# Altium schematic sheet 1.power.SchDoc
size A4; Organization: ORGANIZATION; Address1: ADDRESS 1; Address2: ADDRESS 2; Address3: ADDRESS 3; Address4: ADDRESS 4; DocumentNumber: 2; SheetNumber: 2; SheetTotal: 8; ENG_APP_DATE: --/--/--; DSN_APP_DATE: --/--/--; CHK_APP_DATE: --/--/--; Page: Power; SPICEModelCacheBQMAEVYU: <root> / <DocumentId>BQMAEVYU</DocumentId> / <CacheFrame Number="0"> / <Model Name="irf9510" Kind="CKT"> / <Text>*IRF9510  MCE  4-2-96 / *100V  4A  1.2 ohms HEXFET pkg:TO-220 2,1,3 / .SUBCKT IRF9510  10 20 40 40 / M1   1  2  3  3  DMOS L=1U W=1U / RD  10  1  .569 / RS  30  3  31M / RG  20  2  37.5 / CGS  2  3  182P / EGD 12  0  1  2  1 / VFB 14  0  0 / FFB  1  2  VFB  1 / CGD 13 14  231P / R1  13  0  1 / D1  12 13  DLIM / DDG 15 14  DCGD / R2  12 15  1 / D2  15  0  DLIM / DSD 10  3  DSUB / LS  30 40  7.5N / .MODEL DMOS PMOS (LEVEL=3 THETA=60M VMAX=208K ETA=2M VTO=-3 KP=.471) / .MODEL DCGD D (CJO=231P VJ=.6 M=.68) / .MODEL DSUB D (IS=16.6N N=1.5 RS=1.18 BV=100 CJO=327P VJ=.8 M=.42 TT=82N) / .MODEL DLIM D (IS=100U) / .ENDS IRF9510</Text> / </Model> / </CacheFrame> / </root>
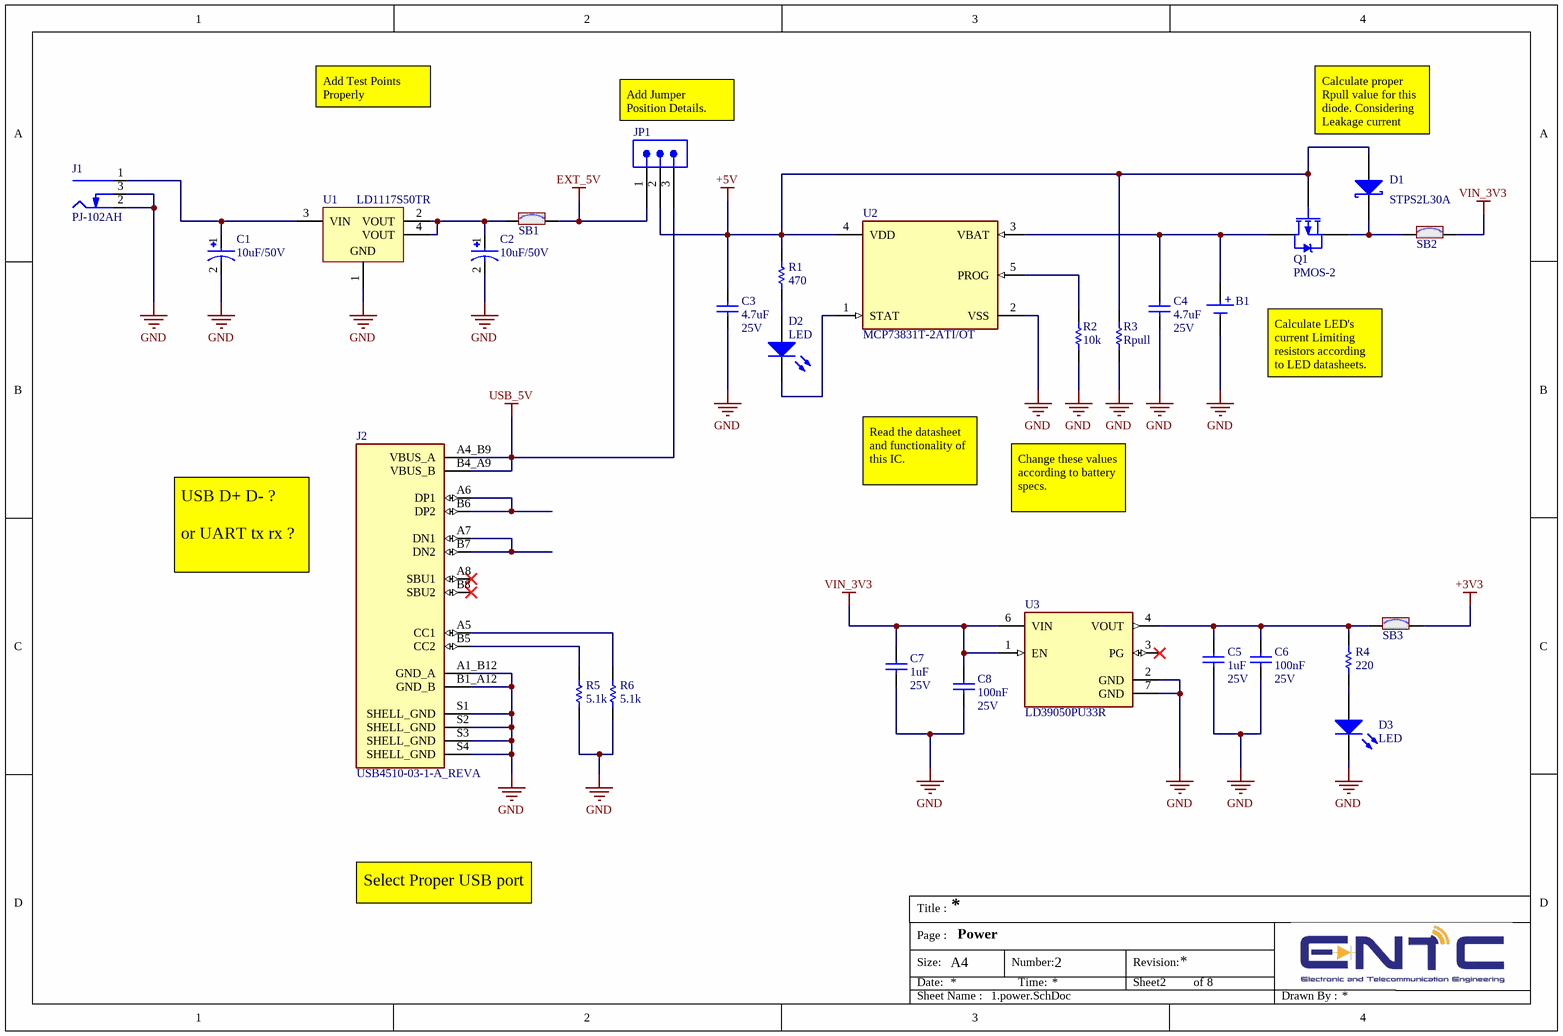
[diagram p0: 1.power.SchDoc]

## Parts
B1  (no value)  [18650_BATTERY_HOLDER]
C1  10uF/50V  [CAP1411]
C2  10uF/50V  [CAP1411]
C3  4.7uF  Voltage Rating: 25V  [cap0603]
C4  4.7uF  Voltage Rating: 25V  [cap0603]
C5  1uF  Voltage Rating: 25V  [cap0603]
C6  100nF  Voltage Rating: 25V  [cap0603]
C7  1uF  Voltage Rating: 25V  [cap0603]
C8  100nF  Voltage Rating: 25V  [cap0603]
D1  STPS2L30A
D2  LED  [LED0603]
D3  LED  [LED0603]
J1  PJ-102AH  [PJ-102AH]
J2  USB4510-03-1-A_REVA  [GCT_USB4510-03-1-A_REVA]
JP1  (no value)  [HEADER_FEMALE_3POS_P2.54MM]
Q1  PMOS-2  [TO-220AB]
R1  470  [RES0402]
R2  10k  [RES0402]
R3  Rpull  [RES0402]
R4  220  [RES0402]
R5  5.1k  [RES0402]
R6  5.1k  [RES0402]
SB1  SB_ON  [SOLDER-BRIDGE_R0603-0R]  (value not drawn)
SB2  SB_ON  [SOLDER-BRIDGE_R0603-0R]  (value not drawn)
SB3  SB_ON  [SOLDER-BRIDGE_R0603-0R]  (value not drawn)
U1  LD1117S50TR  [SOT-223_M]
U2  MCP73831T-2ATI/OT  [SOT95P280X145-5N]
U3  LD39050PU33R  [SON95P300X300X100-7N]

## Nets
+3V3: SB3.2
+5V: C3.2 D1.1(A) JP1.2 Q1.1(G) R1.2 R3.2 U2.4(VDD)
EXT_5V: JP1.1 SB1.2
GND: B1.2(-) C1.2 C2.2 C3.1 C4.1 C5.1 C6.1 C7.1 C8.1 D3.2(K) J1.2(Outer) J1.3(SW) J2.A1_B12(GND_A) J2.B1_A12(GND_B) J2.S1(SHELL_GND) J2.S2(SHELL_GND) J2.S3(SHELL_GND) J2.S4(SHELL_GND) R2.1 R3.1 R5.1 R6.1 U1.1(GND) U2.2(VSS) U3.2(GND) U3.7(GND)
USB_5V: J2.A4_B9(VBUS_A) J2.B4_A9(VBUS_B) JP1.3
VIN_3V3: C7.2 C8.2 SB2.2 U3.1(EN) U3.6(VIN)
NetB1_1: B1.1(+) C4.2 Q1.2(D) U2.3(VBAT)
NetC1_1: C1.1 J1.1(Centre) U1.3(VIN)
NetC2_1: C2.1 SB1.1 U1.2(VOUT) U1.4(VOUT)
NetC5_2: C5.2 C6.2 R4.2 SB3.1 U3.4(VOUT)
NetD1_2: D1.2(K) Q1.3(S) SB2.1
NetD2_1: D2.1(A) R1.1
NetD2_2: D2.2(K) U2.1(STAT)
NetD3_1: D3.1(A) R4.1
NetJ2_A5: J2.A5(CC1) R6.2
NetJ2_A6: J2.A6(DP1) J2.B6(DP2)
NetJ2_A7: J2.A7(DN1) J2.B7(DN2)
NetJ2_B5: J2.B5(CC2) R5.2
NetR2_2: R2.2 U2.5(PROG)

Not connected (* = marked no-connect by the designer): J2 A8(SBU1)* B8(SBU2)*; U3 3(PG)*

## Notes on the sheet
- Add Test Points Properly
- (near JP1) Add Jumper Position Details.
- Calculate proper Rpull value for this diode. Considering Leakage current
- Calculate LED's current Limiting resistors according to LED datasheets.
- Read the datasheet and functionality of this IC.
- Change these values according to battery specs.
- USB D+ D- ?
  or UART tx rx ?
- Select Proper USB port
- Title :
- Size:
- Date:
- Page :
- A4
- Number:
- Time:
- Revision:
- Sheet
- of
- Sheet Name :
- Drawn By :

## Library data of the parts
B1 = Battery_2: BATTERY HOLDER 18650 PC PIN; Part Number: 1043; Manufacturer: Keystone Electronics; Battery Cell Size: 18650; Battery Type, Function: Cylindrical, Holder; Number of Cells: 1; Style: Holder (Open); ComponentLink1Description: Datasheet; ComponentLink1URL: http://keyelco.com/userAssets/file/M65p27.pdf; ComponentLink2Description: DigiKey Link; ComponentLink2URL: http://digikey.com/product-detail/en/keystone-electronics/1043/36-1043-ND/2745669; Height Above Board: 0.585" (14.86mm); LastUpdated: 2/2/2020 9:19:56 AM; Lifecycle Status: Active; Minimum Order: 1; Mounting Type: PCB, Through Hole; Operating Temperature: -50°C ~ 145°C; Packaging: Unknown; PartId: 2; Part Status: Active; Price: 2.58; Series: -; Supplier 1: DigiKey; Supplier Part Number 1: 36-1043-ND; Termination Style: PC Pin
C1 C2 = Cap Pol: Polarized capacitor; Manufacturer: *; Manufacturer part number: *; JLCPCB part number: *
C3-C8 = Cap: Capacitor; MF: *; MP: *; JLCPCB: *
D1 = D Schottky: 30V 450mV@2A 2A SMA(DO-214AC) Schottky Diodes ROHS; MF: STMicroelectronics; MP: STPS2L30A; JLCPCB: C133102
D2 D3 = LED: Light Emitting Diode; Manufacturer: *; Manufacturer part number: *; JLCPCB part number: *
J1 = Barrel_Connector: CONN PWR JACK 2X5.5MM SOLDER; Manufacturer: CUI Devices; Actual Diameter: 0.079" (2.00mm ID), 0.256" (6.50mm OD); Current Rating (Amps): 5A; Gender: Male; Industry Recognized Mating Diameter: 2.00mm ID (0.079"), 5.50mm OD (0.217"); Internal Switch(s): Single Switch, Normally Closed; Material Flammability Rating: UL94 V-0; Mating Length/Depth: 0.354" (9.00mm); Number of Positions/Contacts: 2 Conductors, 3 Contacts; Shielding: Unshielded; Voltage - Rated: 24VDC; Part Number: PJ-102AH; ComponentLink1Description: Datasheet; ComponentLink1URL: https://www.cuidevices.com/product/resource/digikeypdf/pj-102ah.pdf; ComponentLink2Description: DigiKey Link; ComponentLink2URL: //digikey.com/product-detail/en/cui-devices/PJ-102AH/CP-102AH-ND/408448; Connector Type: Jack; LastUpdated: 12/16/2019 7:01:27 PM; Lifecycle Status: 0; Minimum Order: 1; Mounting Type: Through Hole, Right Angle; Packaging: Tray; Part Status: Active; Price: 0.76; Series: -; Supplier 1: DigiKey; Supplier Part Number 1: CP-102AH-ND; Termination: Solder
J2 = USB4510-03-1-A_REVA: USB-C (USB TYPE-C) Receptacle Connector 24 (16+8 Dummy) Position Board Edge, Cutout; Surface Mount; Through Hole, Right Angle; Manufacturer: On Shore Technology Inc.; Manufacturer part number: USB-CC16HMWTR; Digikey part number: 52-USB-CC16HMWTR
JP1 = 3 Pin Jumper: Part Number: NC6-P108-03; Manufacturer: TE Connectivity AMP Connectors; Barrier Type: 2 Wall (Dual); Bottom Termination: PC Pin; Current Rating (Amps): 20A; Number of Circuits: 3; Pitch: 0.375" (9.53mm); Top Termination: Screws with Captive Plate; Voltage Rating: 300V; Wire Gauge: 12-22 AWG; Color: Black; ComponentLink1Description: Datasheet; ComponentLink1URL: https://www.te.com/commerce/DocumentDelivery/DDEController?Action=srchrtrv&DocNm=3-1437664-0&DocType=Customer+Drawing&DocLang=English; ComponentLink2Description: DigiKey Link; ComponentLink2URL: http://digikey.com/product-detail/en/te-connectivity-amp-connectors/NC6-P108-03/A98496-ND/1277927; LastUpdated: 1/15/2020 4:12:05 AM; Lifecycle Status: Active; Minimum Order: 1; Number of Rows: 1; Number of Wire Entries: 3; Packaging: Bulk; Part Status: Active; Price: 2.16; Series: NC6, Buchanan; Supplier 1: DigiKey; Supplier Part Number 1: A98496-ND; Terminal Block Type: Barrier Block
Q1 = PMOS-2: P-Channel Power MOSFET; Note: Pin 4 not drawn and electrically connected to Pin 2.; Published: 8-Jun-2000; LatestRevisionDate: 17-Jul-2002; LatestRevisionNote: Re-released for DXP Platform.; DatasheetVersion: PD-9.390D; PackageVersion: Feb-1997; PackageReference: TO-220AB; Publisher: Altium Limited; PackageDescription: TO, Thru-Hole, Vertical, Heatsink Mounted; 3 In-Line Leads; Pitch 2.54 mm; ComponentLink1Description: Manufacturer Link; ComponentLink1URL: http://www.irf.com/
R1-R6 = Res: Resistor; Manufacturer: *; Manufacturer part number: *; JLCPCB part number: *
SB1-SB3 = SB_ON: Solder Bridge ON; Internal_Part_Number: MCD-00071; Part_Type: Mechanical; Provided_By: Subcon; Initial_Board_Reference: mb1274; MP: PMR03EZPJ000; ECCN_US: n/a; ECCN_EU: n/a; Status: Released; JLCPCB: C253507
U1 = CMP-0244-00312-1: Fixed Low Drop Positive Voltage Regulator, 5V, 4-Pin SOT-223, Tape and Reel; ComponentLink1URL: http://www.st.com; DatasheetVersion: 1/11/2011; PackageDescription: 4-Pin SOT-223 Package, 6.5 x 3.5 mm Body, 2.3 mm Pitch, 7 mm Lead Span; ComponentLink2URL: http://www.st.com/internet/com/TECHNICAL_RESOURCES/TECHNICAL_LITERATURE/DATASHEET/CD00000544.pdf; ComponentLink1Description: Manufacturer URL; PackageReference: SOT-223; PackageVersion: 2010; ComponentLink2Description: Datasheet
U2 = MCP73831T-2ATI/OT: Microchip MCP73831T-2ATI/OT, Battery Charge Controller, 500mA, 5-Pin SOT-23 | Microchip Technology Inc. MCP73831T-2ATI/OT; SnapEDA_Link: https://www.snapeda.com/parts/MCP73831T-2ATI/OT/Microchip/view-part/?ref=snap; Package: SOT-23 Microchip; Value: *; MF: Microchip; MP: MCP73831T-2ATI/OT; Check_prices: https://www.snapeda.com/parts/MCP73831T-2ATI/OT/Microchip/view-part/?ref=eda
U3 = LD39050PU33R: Linear Voltage Regulator IC Positive Fixed 1 Output 500mA 6-DFN (3x3); MF: STMicroelectronics; SnapEDA_Link: https://www.snapeda.com/parts/LD39050PU33R/STMicroelectronics/view-part/?ref=snap; Package: DFN-6 STMicroelectronics; Value: *; MP: LD39050PU33R; Check_prices: https://www.snapeda.com/parts/LD39050PU33R/STMicroelectronics/view-part/?ref=eda